# Altium project IDC_Tester_v1.PrjPcb (part 2 of 3)

## Sheet IDC_Tester_v1_LED_3.SchDoc
size 420 x 297 mm; SheetNumber: 5; SheetTotal: 9
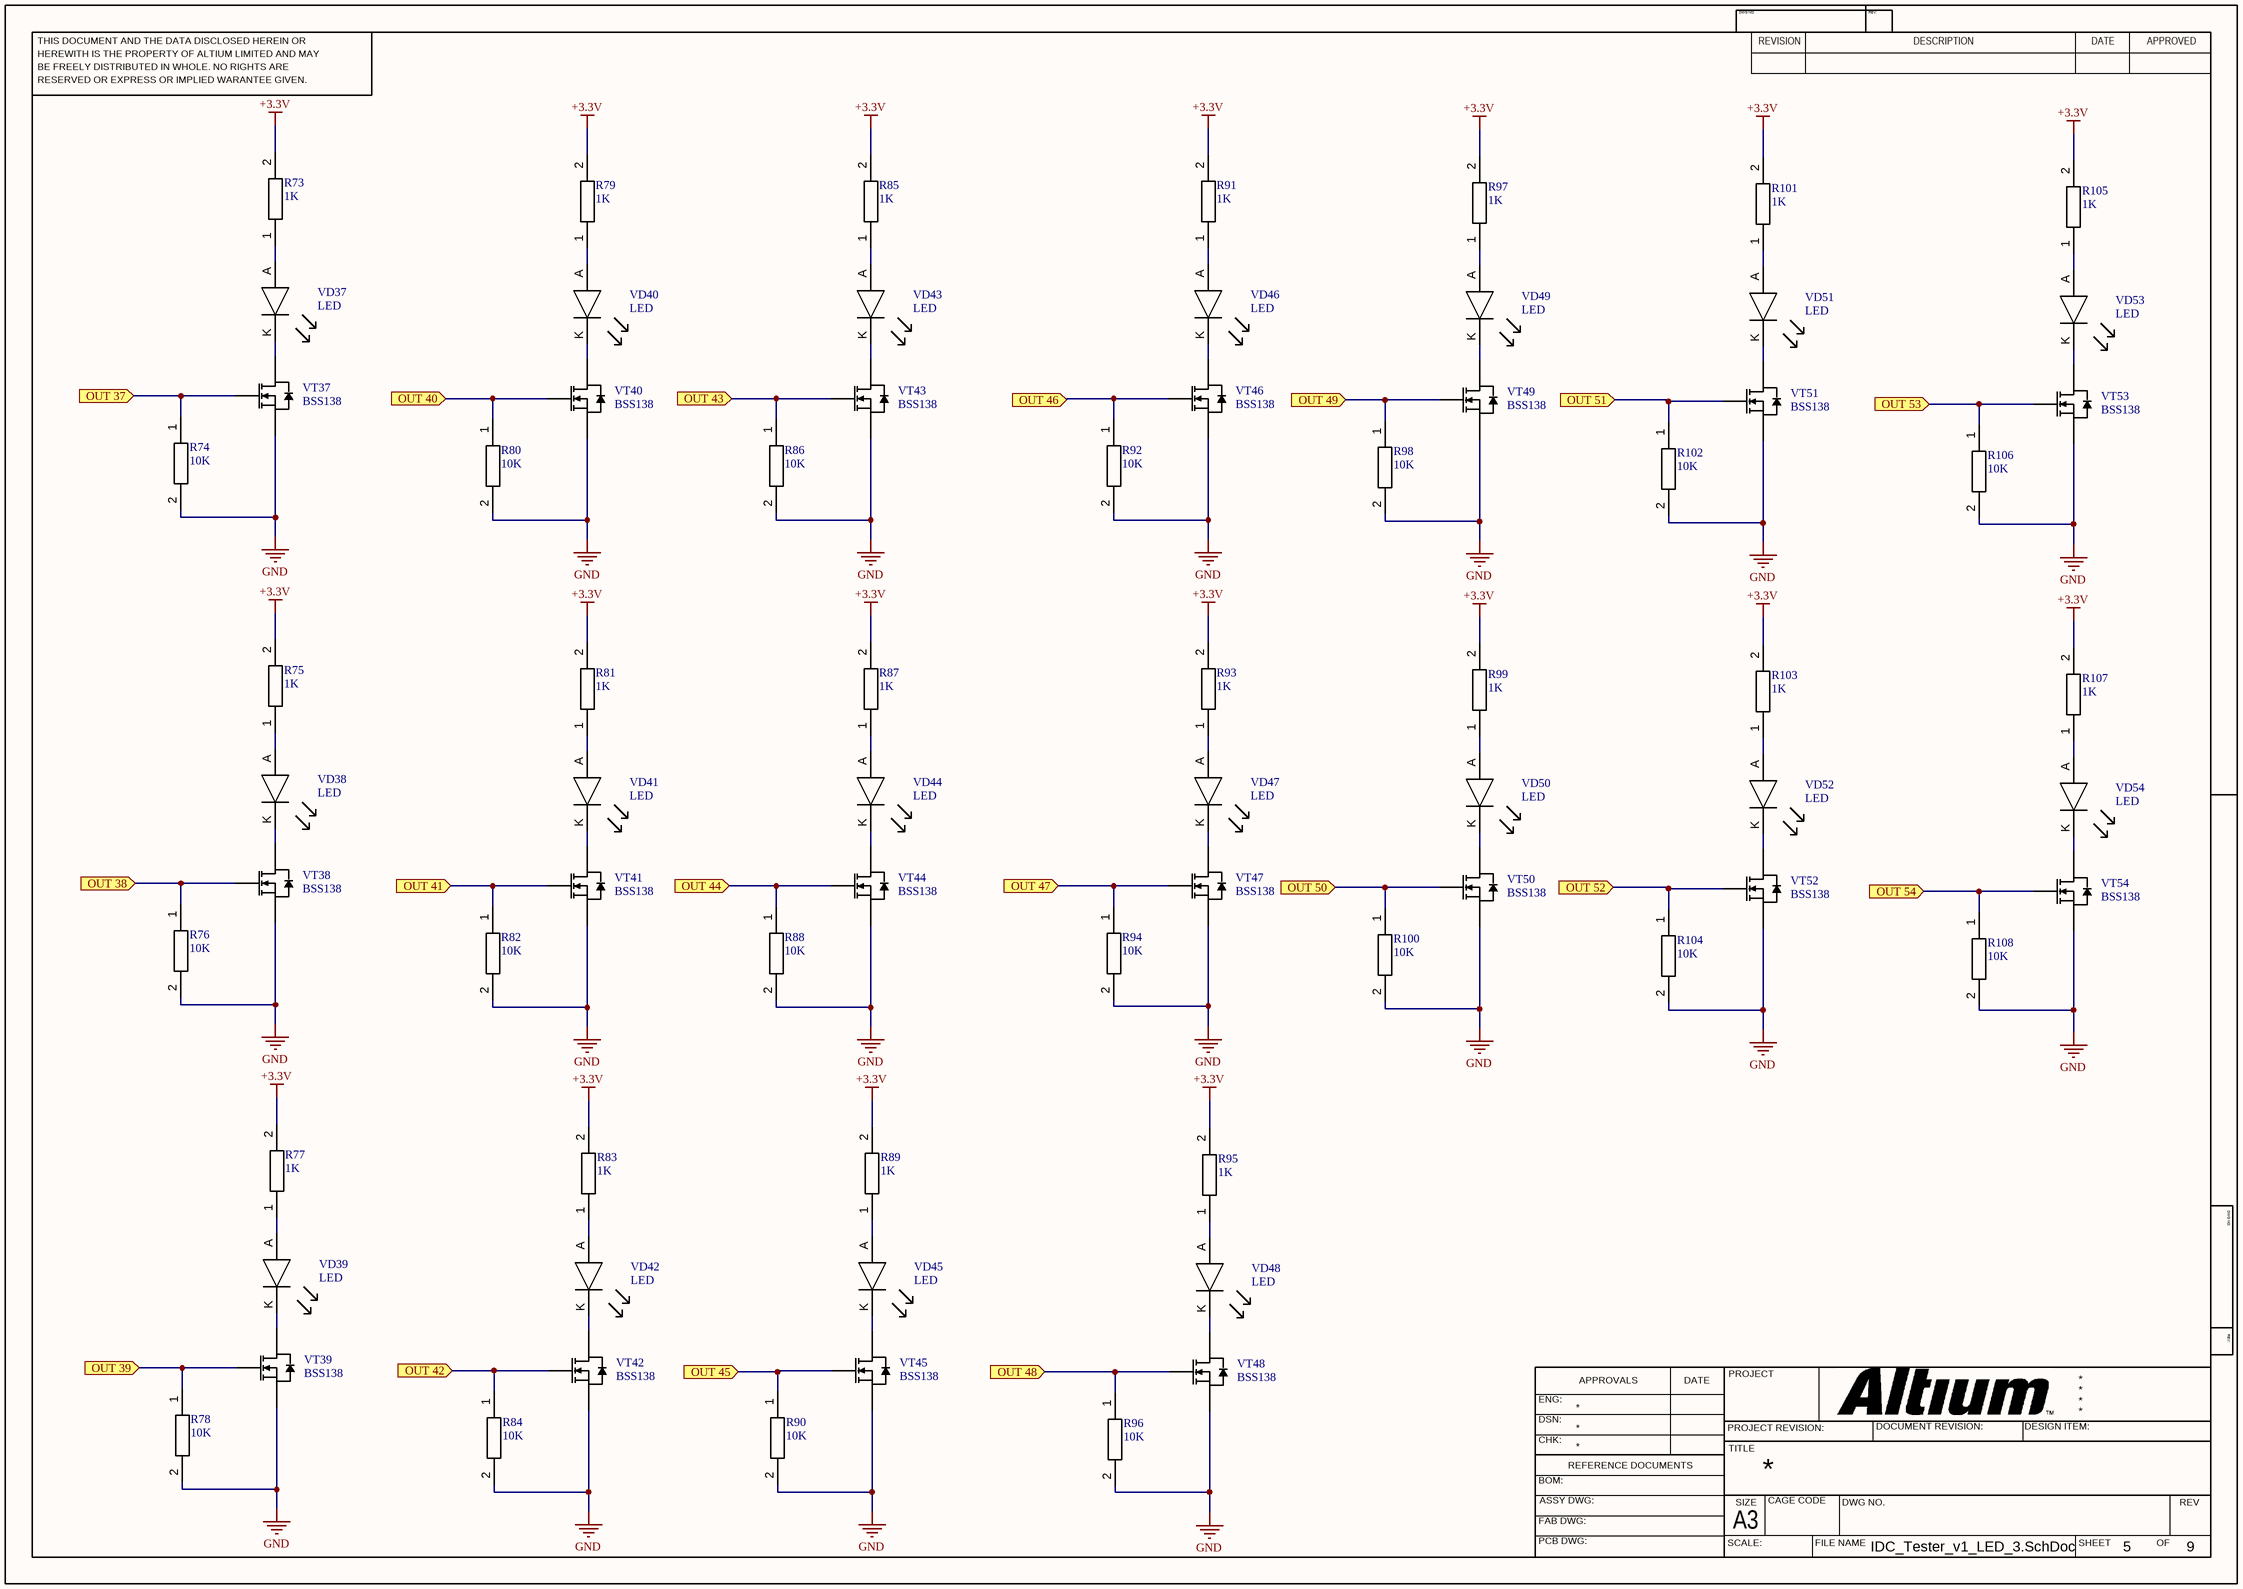
[diagram p5: IDC_Tester_v1_LED_3.SchDoc]

### Parts
R73  1K  [Resistor 0603]
R74  10K  [Resistor 0603]
R75  1K  [Resistor 0603]
R76  10K  [Resistor 0603]
R77  1K  [Resistor 0603]
R78  10K  [Resistor 0603]
R79  1K  [Resistor 0603]
R80  10K  [Resistor 0603]
R81  1K  [Resistor 0603]
R82  10K  [Resistor 0603]
R83  1K  [Resistor 0603]
R84  10K  [Resistor 0603]
R85  1K  [Resistor 0603]
R86  10K  [Resistor 0603]
R87  1K  [Resistor 0603]
R88  10K  [Resistor 0603]
R89  1K  [Resistor 0603]
R90  10K  [Resistor 0603]
R91  1K  [Resistor 0603]
R92  10K  [Resistor 0603]
R93  1K  [Resistor 0603]
R94  10K  [Resistor 0603]
R95  1K  [Resistor 0603]
R96  10K  [Resistor 0603]
R97  1K  [Resistor 0603]
R98  10K  [Resistor 0603]
R99  1K  [Resistor 0603]
R100  10K  [Resistor 0603]
R101  1K  [Resistor 0603]
R102  10K  [Resistor 0603]
R103  1K  [Resistor 0603]
R104  10K  [Resistor 0603]
R105  1K  [Resistor 0603]
R106  10K  [Resistor 0603]
R107  1K  [Resistor 0603]
R108  10K  [Resistor 0603]
VD37  LED  [Led 0603 - duplicate]
VD38  LED  [Led 0603 - duplicate]
VD39  LED  [Led 0603 - duplicate]
VD40  LED  [Led 0603 - duplicate]
VD41  LED  [Led 0603 - duplicate]
VD42  LED  [Led 0603 - duplicate]
VD43  LED  [Led 0603 - duplicate]
VD44  LED  [Led 0603 - duplicate]
VD45  LED  [Led 0603 - duplicate]
VD46  LED  [Led 0603 - duplicate]
VD47  LED  [Led 0603 - duplicate]
VD48  LED  [Led 0603 - duplicate]
VD49  LED  [Led 0603 - duplicate]
VD50  LED  [Led 0603 - duplicate]
VD51  LED  [Led 0603 - duplicate]
VD52  LED  [Led 0603 - duplicate]
VD53  LED  [Led 0603 - duplicate]
VD54  LED  [Led 0603 - duplicate]
VT37  BSS138  [SOT-23-3]
VT38  BSS138  [SOT-23-3]
VT39  BSS138  [SOT-23-3]
VT40  BSS138  [SOT-23-3]
VT41  BSS138  [SOT-23-3]
VT42  BSS138  [SOT-23-3]
VT43  BSS138  [SOT-23-3]
VT44  BSS138  [SOT-23-3]
VT45  BSS138  [SOT-23-3]
VT46  BSS138  [SOT-23-3]
VT47  BSS138  [SOT-23-3]
VT48  BSS138  [SOT-23-3]
VT49  BSS138  [SOT-23-3]
VT50  BSS138  [SOT-23-3]
VT51  BSS138  [SOT-23-3]
VT52  BSS138  [SOT-23-3]
VT53  BSS138  [SOT-23-3]
VT54  BSS138  [SOT-23-3]

### Ports
OUT 37 (in), OUT 38 (in), OUT 39 (in), OUT 40 (in), OUT 41 (in), OUT 42 (in), OUT 43 (in), OUT 44 (in), OUT 45 (in), OUT 46 (in), OUT 47 (in), OUT 48 (in), OUT 49 (in), OUT 50 (in), OUT 51 (in), OUT 52 (in), OUT 53 (in), OUT 54 (in)

### Nets
+3.3V: R73.2 R75.2 R77.2 R79.2 R81.2 R83.2 R85.2 R87.2 R89.2 R91.2 R93.2 R95.2 R97.2 R99.2 R101.2 R103.2 R105.2 R107.2
GND: R74.2 R76.2 R78.2 R80.2 R82.2 R84.2 R86.2 R88.2 R90.2 R92.2 R94.2 R96.2 R98.2 R100.2 R102.2 R104.2 R106.2 R108.2 VT37.2(S) VT38.2(S) VT39.2(S) VT40.2(S) VT41.2(S) VT42.2(S) VT43.2(S) VT44.2(S) VT45.2(S) VT46.2(S) VT47.2(S) VT48.2(S) VT49.2(S) VT50.2(S) VT51.2(S) VT52.2(S) VT53.2(S) VT54.2(S)
NetDD18_3: R74.1 VT37.1(G) ; port OUT 37
NetDD18_4: R76.1 VT38.1(G) ; port OUT 38
NetDD18_5: R78.1 VT39.1(G) ; port OUT 39
NetDD18_6: R80.1 VT40.1(G) ; port OUT 40
NetDD19_3: R90.1 VT45.1(G) ; port OUT 45
NetDD19_4: R92.1 VT46.1(G) ; port OUT 46
NetDD19_5: R94.1 VT47.1(G) ; port OUT 47
NetDD19_6: R96.1 VT48.1(G) ; port OUT 48
NetDD19_11: R82.1 VT41.1(G) ; port OUT 41
NetDD19_12: R84.1 VT42.1(G) ; port OUT 42
NetDD19_13: R86.1 VT43.1(G) ; port OUT 43
NetDD19_14: R88.1 VT44.1(G) ; port OUT 44
NetDD20_3: R106.1 VT53.1(G) ; port OUT 53
NetDD20_4: R108.1 VT54.1(G) ; port OUT 54
NetDD20_11: R98.1 VT49.1(G) ; port OUT 49
NetDD20_12: R100.1 VT50.1(G) ; port OUT 50
NetDD20_13: R102.1 VT51.1(G) ; port OUT 51
NetDD20_14: R104.1 VT52.1(G) ; port OUT 52
NetR73_1: R73.1 VD37.A
NetR75_1: R75.1 VD38.A
NetR77_1: R77.1 VD39.A
NetR79_1: R79.1 VD40.A
NetR81_1: R81.1 VD41.A
NetR83_1: R83.1 VD42.A
NetR85_1: R85.1 VD43.A
NetR87_1: R87.1 VD44.A
NetR89_1: R89.1 VD45.A
NetR91_1: R91.1 VD46.A
NetR93_1: R93.1 VD47.A
NetR95_1: R95.1 VD48.A
NetR97_1: R97.1 VD49.A
NetR99_1: R99.1 VD50.A
NetR101_1: R101.1 VD51.A
NetR103_1: R103.1 VD52.A
NetR105_1: R105.1 VD53.A
NetR107_1: R107.1 VD54.A
NetVD37_K: VD37.K VT37.3(D)
NetVD38_K: VD38.K VT38.3(D)
NetVD39_K: VD39.K VT39.3(D)
NetVD40_K: VD40.K VT40.3(D)
NetVD41_K: VD41.K VT41.3(D)
NetVD42_K: VD42.K VT42.3(D)
NetVD43_K: VD43.K VT43.3(D)
NetVD44_K: VD44.K VT44.3(D)
NetVD45_K: VD45.K VT45.3(D)
NetVD46_K: VD46.K VT46.3(D)
NetVD47_K: VD47.K VT47.3(D)
NetVD48_K: VD48.K VT48.3(D)
NetVD49_K: VD49.K VT49.3(D)
NetVD50_K: VD50.K VT50.3(D)
NetVD51_K: VD51.K VT51.3(D)
NetVD52_K: VD52.K VT52.3(D)
NetVD53_K: VD53.K VT53.3(D)
NetVD54_K: VD54.K VT54.3(D)

### Notes on the sheet
- THIS DOCUMENT AND THE DATA DISCLOSED HEREIN OR
- HEREWITH IS THE PROPERTY OF ALTIUM LIMITED AND MAY
- DWG NO:
- REVISION
- REV:
- DESCRIPTION
- DATE
- APPROVED
- BE FREELY DISTRIBUTED IN WHOLE. NO RIGHTS ARE
- RESERVED OR EXPRESS OR IMPLIED WARANTEE GIVEN.
- ENG:
- APPROVALS
- PROJECT
- DSN:
- CHK:
- REFERENCE DOCUMENTS
- PROJECT REVISION:
- TITLE
- DOCUMENT REVISION:
- DESIGN ITEM:
- BOM:
- FAB DWG:
- PCB DWG:
- ASSY DWG:
- SCALE:
- A3
- SIZE
- CAGE CODE
- FILE NAME
- DWG NO.
- SHEET
- OF
- REV

### Library data of the parts
R73 R75 R77 R79 R81 R83 R85 R87 R89 R91 R93 R95 R97 R99 R101 R103 R105 R107 = Resistor 1K: as R313 on sheet IDC_Tester_v1_mcu; Created at: 13/02/2024; Mount: MOUNT
R74 R76 R78 R80 R82 R84 R86 R88 R90 R92 R94 R96 R98 R100 R102 R104 R106 R108 = Resistor 10K: as R318 on sheet IDC_Tester_v1_mcu; Created at: 15/02/2024; Mount: MOUNT
VD37-VD54 = LED: as VD97 on sheet IDC_Tester_v1_mcu; RoHS: Yes; Category: LEDs; Stock 1: 44996; Pricing 1: 1=0,6, 10=0,368, 100=0,2114, 1000=0,16544, 2000=0,15165 (USD); MountType: SMD; Case/Package: 0603; Color: Green; Case Code (Imperial): 0603; Case Code (Metric): 1608; Packaging: Tape and Reel; Length: 1.6mm; Width: 0.8mm; Height: 0.28mm; RoHS Compliant: Yes; ComponentLink1URL: https://datasheet.octopart.com/APG1608ZGCK-Kingbright-datasheet-153682089.pdf?src-supplier=Future+Electronics; ComponentLink1Description: https://datasheet.octopart.com/APG1608ZGCK-Kingbright-datasheet-153682089.pdf?src-supplier=Future+Electronics; ComponentLink2URL: http://www.kingbrightusa.com/images/catalog/SPEC/APG1608ZGCK.pdf?src-supplier=Digikey; ComponentLink2Description: http://www.kingbrightusa.com/images/catalog/SPEC/APG1608ZGCK.pdf?src-supplier=Digikey; ComponentLink3URL: https://datasheet.octopart.com/APG1608ZGCK-Kingbright-datasheet-137408059.pdf?src-supplier=Sager+Electronics; ComponentLink3Description: https://datasheet.octopart.com/APG1608ZGCK-Kingbright-datasheet-137408059.pdf?src-supplier=Sager+Electronics; Supplier Part Number 1: 754-2113-1-ND; Created at: 13/02/2024; Mount: MOUNT; Part Number: APG1608ZGCK; Supplier 1: Digikey
VT37-VT54 = BSS138: as VT1 on sheet IDC_Tester_v1_LED; Part Number: BSS138; Mount: MOUNT; MountType: SMD; Created_at: 03/12/2019

## Sheet IDC_Tester_v1_LED_4.SchDoc
size 420 x 297 mm; SheetNumber: 6; SheetTotal: 9
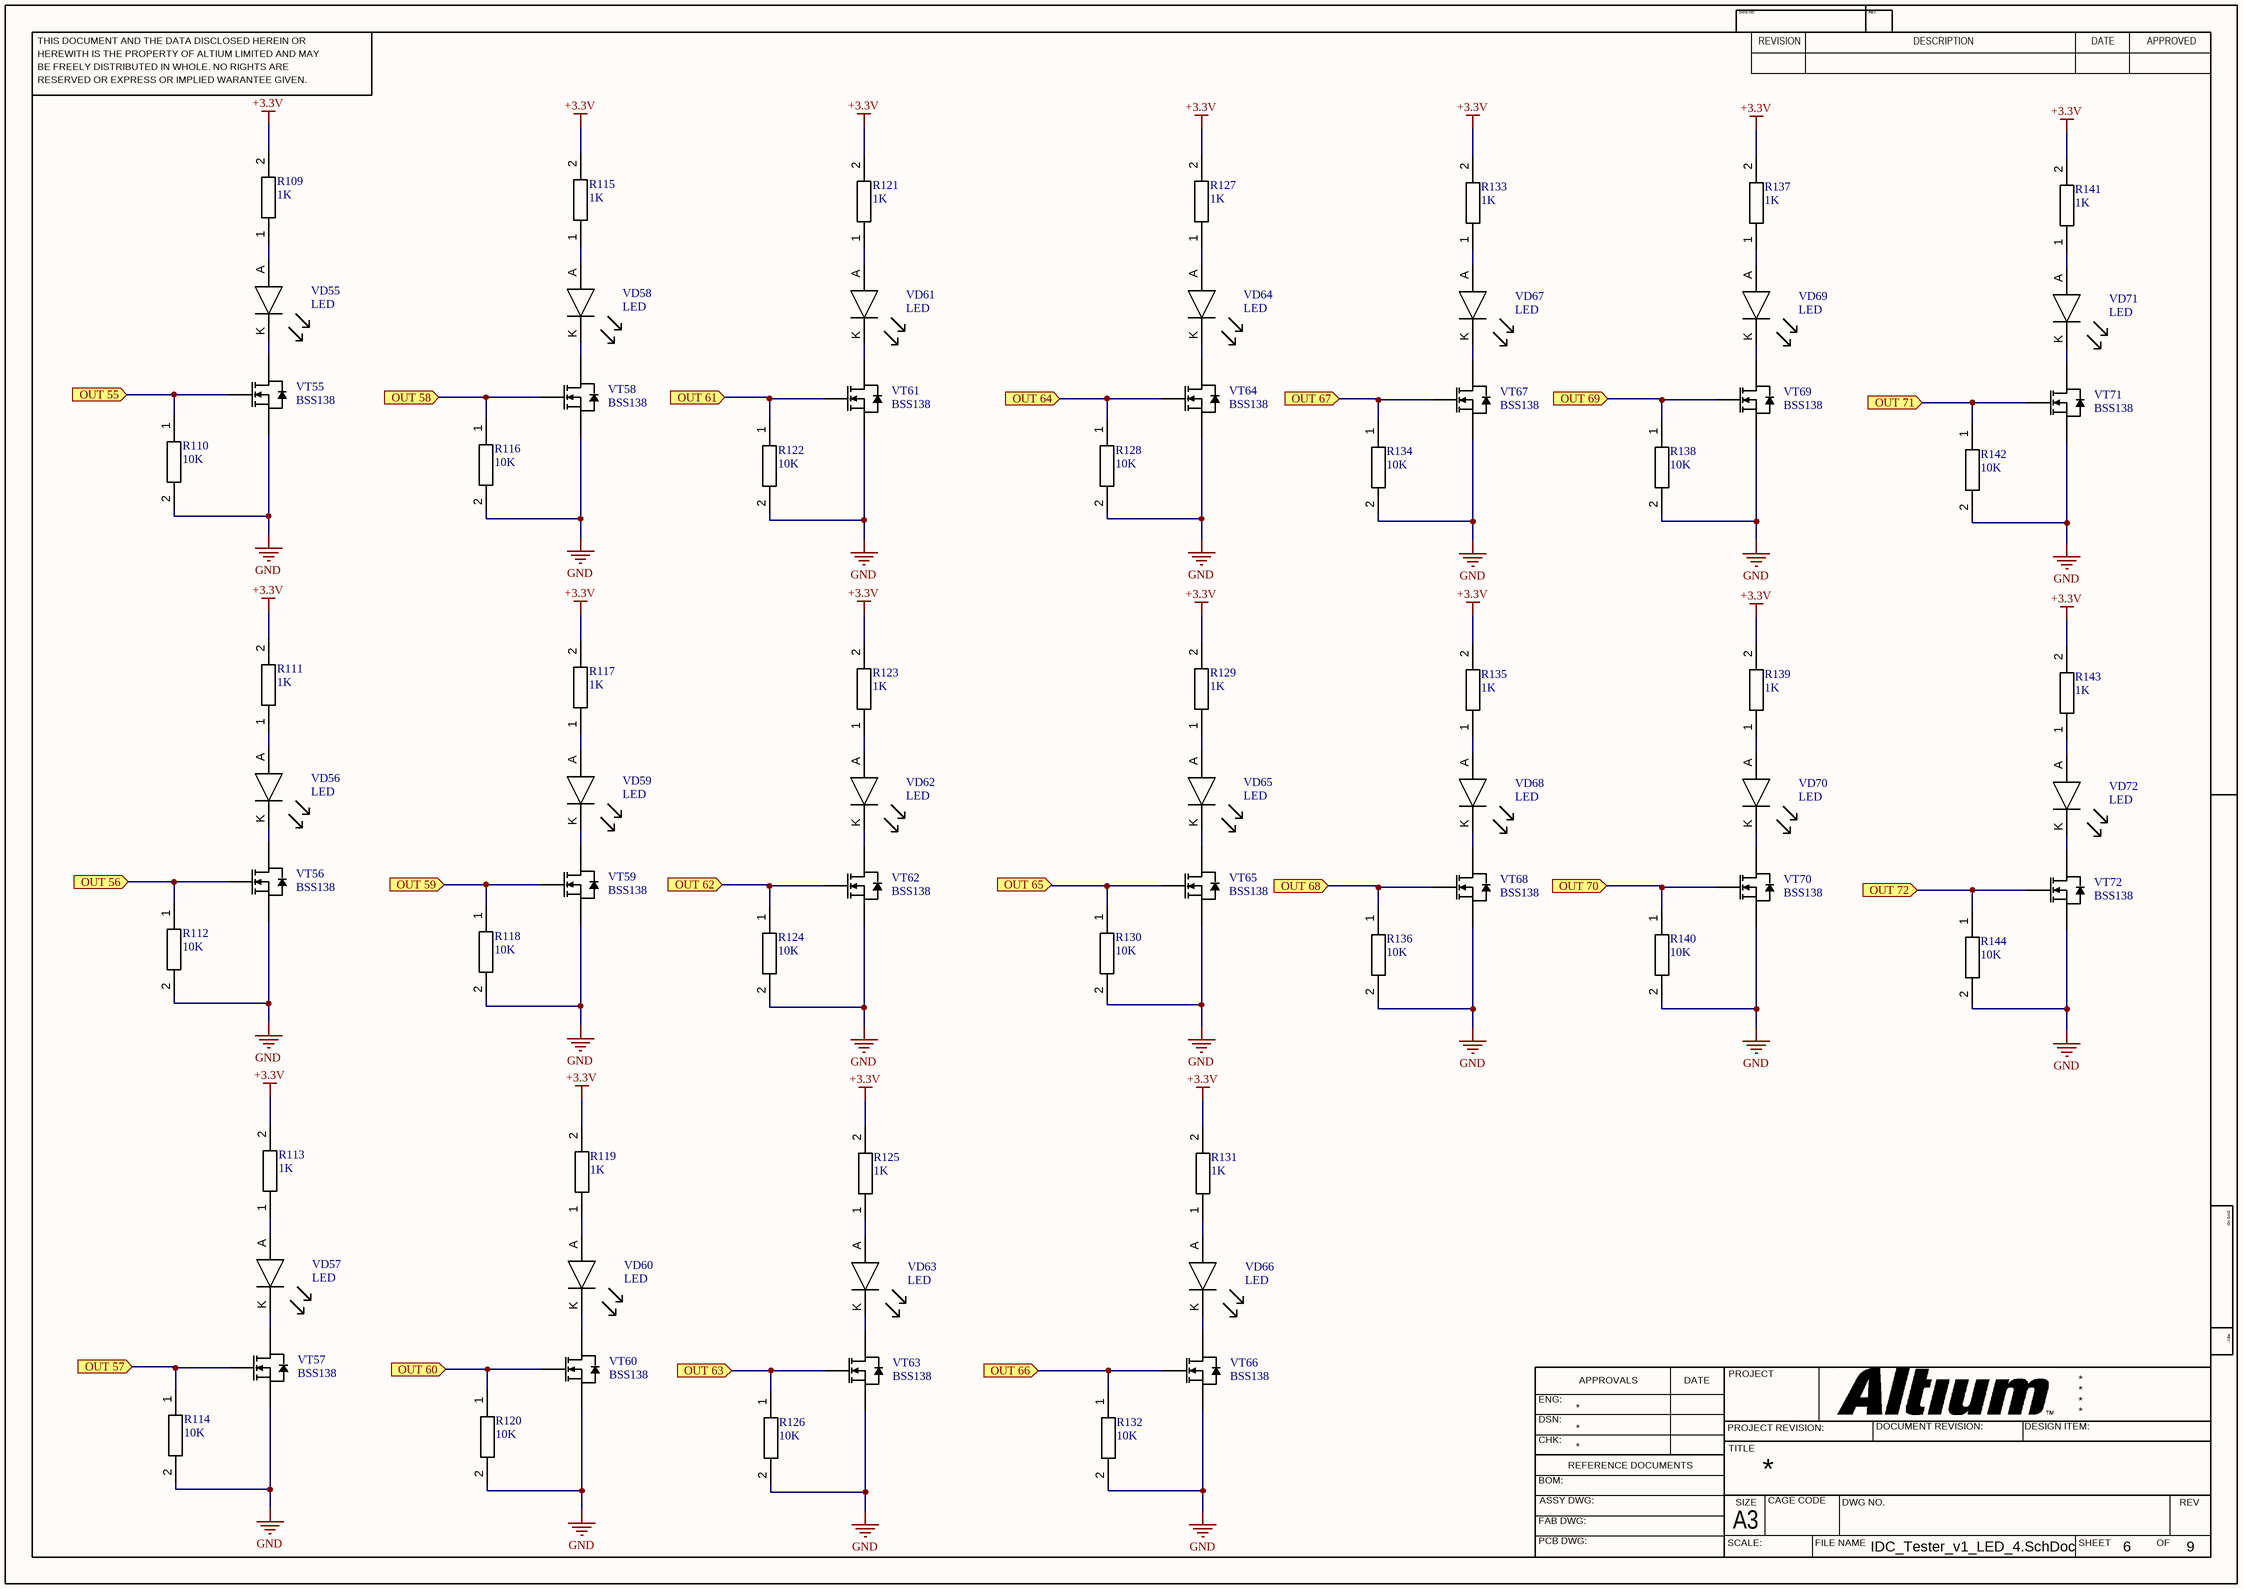
[diagram p6: IDC_Tester_v1_LED_4.SchDoc]

### Parts
R109  1K  [Resistor 0603]
R110  10K  [Resistor 0603]
R111  1K  [Resistor 0603]
R112  10K  [Resistor 0603]
R113  1K  [Resistor 0603]
R114  10K  [Resistor 0603]
R115  1K  [Resistor 0603]
R116  10K  [Resistor 0603]
R117  1K  [Resistor 0603]
R118  10K  [Resistor 0603]
R119  1K  [Resistor 0603]
R120  10K  [Resistor 0603]
R121  1K  [Resistor 0603]
R122  10K  [Resistor 0603]
R123  1K  [Resistor 0603]
R124  10K  [Resistor 0603]
R125  1K  [Resistor 0603]
R126  10K  [Resistor 0603]
R127  1K  [Resistor 0603]
R128  10K  [Resistor 0603]
R129  1K  [Resistor 0603]
R130  10K  [Resistor 0603]
R131  1K  [Resistor 0603]
R132  10K  [Resistor 0603]
R133  1K  [Resistor 0603]
R134  10K  [Resistor 0603]
R135  1K  [Resistor 0603]
R136  10K  [Resistor 0603]
R137  1K  [Resistor 0603]
R138  10K  [Resistor 0603]
R139  1K  [Resistor 0603]
R140  10K  [Resistor 0603]
R141  1K  [Resistor 0603]
R142  10K  [Resistor 0603]
R143  1K  [Resistor 0603]
R144  10K  [Resistor 0603]
VD55  LED  [Led 0603 - duplicate]
VD56  LED  [Led 0603 - duplicate]
VD57  LED  [Led 0603 - duplicate]
VD58  LED  [Led 0603 - duplicate]
VD59  LED  [Led 0603 - duplicate]
VD60  LED  [Led 0603 - duplicate]
VD61  LED  [Led 0603 - duplicate]
VD62  LED  [Led 0603 - duplicate]
VD63  LED  [Led 0603 - duplicate]
VD64  LED  [Led 0603 - duplicate]
VD65  LED  [Led 0603 - duplicate]
VD66  LED  [Led 0603 - duplicate]
VD67  LED  [Led 0603 - duplicate]
VD68  LED  [Led 0603 - duplicate]
VD69  LED  [Led 0603 - duplicate]
VD70  LED  [Led 0603 - duplicate]
VD71  LED  [Led 0603 - duplicate]
VD72  LED  [Led 0603 - duplicate]
VT55  BSS138  [SOT-23-3]
VT56  BSS138  [SOT-23-3]
VT57  BSS138  [SOT-23-3]
VT58  BSS138  [SOT-23-3]
VT59  BSS138  [SOT-23-3]
VT60  BSS138  [SOT-23-3]
VT61  BSS138  [SOT-23-3]
VT62  BSS138  [SOT-23-3]
VT63  BSS138  [SOT-23-3]
VT64  BSS138  [SOT-23-3]
VT65  BSS138  [SOT-23-3]
VT66  BSS138  [SOT-23-3]
VT67  BSS138  [SOT-23-3]
VT68  BSS138  [SOT-23-3]
VT69  BSS138  [SOT-23-3]
VT70  BSS138  [SOT-23-3]
VT71  BSS138  [SOT-23-3]
VT72  BSS138  [SOT-23-3]

### Ports
OUT 55 (in), OUT 56 (in), OUT 57 (in), OUT 58 (in), OUT 59 (in), OUT 60 (in), OUT 61 (in), OUT 62 (in), OUT 63 (in), OUT 64 (in), OUT 65 (in), OUT 66 (in), OUT 67 (in), OUT 68 (in), OUT 69 (in), OUT 70 (in), OUT 71 (in), OUT 72 (in)

### Nets
+3.3V: R109.2 R111.2 R113.2 R115.2 R117.2 R119.2 R121.2 R123.2 R125.2 R127.2 R129.2 R131.2 R133.2 R135.2 R137.2 R139.2 R141.2 R143.2
GND: R110.2 R112.2 R114.2 R116.2 R118.2 R120.2 R122.2 R124.2 R126.2 R128.2 R130.2 R132.2 R134.2 R136.2 R138.2 R140.2 R142.2 R144.2 VT55.2(S) VT56.2(S) VT57.2(S) VT58.2(S) VT59.2(S) VT60.2(S) VT61.2(S) VT62.2(S) VT63.2(S) VT64.2(S) VT65.2(S) VT66.2(S) VT67.2(S) VT68.2(S) VT69.2(S) VT70.2(S) VT71.2(S) VT72.2(S)
NetDD20_5: R110.1 VT55.1(G) ; port OUT 55
NetDD20_6: R112.1 VT56.1(G) ; port OUT 56
NetDD21_3: R122.1 VT61.1(G) ; port OUT 61
NetDD21_4: R124.1 VT62.1(G) ; port OUT 62
NetDD21_5: R126.1 VT63.1(G) ; port OUT 63
NetDD21_6: R128.1 VT64.1(G) ; port OUT 64
NetDD21_11: R114.1 VT57.1(G) ; port OUT 57
NetDD21_12: R116.1 VT58.1(G) ; port OUT 58
NetDD21_13: R118.1 VT59.1(G) ; port OUT 59
NetDD21_14: R120.1 VT60.1(G) ; port OUT 60
NetDD22_3: R138.1 VT69.1(G) ; port OUT 69
NetDD22_4: R140.1 VT70.1(G) ; port OUT 70
NetDD22_5: R142.1 VT71.1(G) ; port OUT 71
NetDD22_6: R144.1 VT72.1(G) ; port OUT 72
NetDD22_11: R130.1 VT65.1(G) ; port OUT 65
NetDD22_12: R132.1 VT66.1(G) ; port OUT 66
NetDD22_13: R134.1 VT67.1(G) ; port OUT 67
NetDD22_14: R136.1 VT68.1(G) ; port OUT 68
NetR109_1: R109.1 VD55.A
NetR111_1: R111.1 VD56.A
NetR113_1: R113.1 VD57.A
NetR115_1: R115.1 VD58.A
NetR117_1: R117.1 VD59.A
NetR119_1: R119.1 VD60.A
NetR121_1: R121.1 VD61.A
NetR123_1: R123.1 VD62.A
NetR125_1: R125.1 VD63.A
NetR127_1: R127.1 VD64.A
NetR129_1: R129.1 VD65.A
NetR131_1: R131.1 VD66.A
NetR133_1: R133.1 VD67.A
NetR135_1: R135.1 VD68.A
NetR137_1: R137.1 VD69.A
NetR139_1: R139.1 VD70.A
NetR141_1: R141.1 VD71.A
NetR143_1: R143.1 VD72.A
NetVD55_K: VD55.K VT55.3(D)
NetVD56_K: VD56.K VT56.3(D)
NetVD57_K: VD57.K VT57.3(D)
NetVD58_K: VD58.K VT58.3(D)
NetVD59_K: VD59.K VT59.3(D)
NetVD60_K: VD60.K VT60.3(D)
NetVD61_K: VD61.K VT61.3(D)
NetVD62_K: VD62.K VT62.3(D)
NetVD63_K: VD63.K VT63.3(D)
NetVD64_K: VD64.K VT64.3(D)
NetVD65_K: VD65.K VT65.3(D)
NetVD66_K: VD66.K VT66.3(D)
NetVD67_K: VD67.K VT67.3(D)
NetVD68_K: VD68.K VT68.3(D)
NetVD69_K: VD69.K VT69.3(D)
NetVD70_K: VD70.K VT70.3(D)
NetVD71_K: VD71.K VT71.3(D)
NetVD72_K: VD72.K VT72.3(D)

### Notes on the sheet
- THIS DOCUMENT AND THE DATA DISCLOSED HEREIN OR
- HEREWITH IS THE PROPERTY OF ALTIUM LIMITED AND MAY
- DWG NO:
- REVISION
- REV:
- DESCRIPTION
- DATE
- APPROVED
- BE FREELY DISTRIBUTED IN WHOLE. NO RIGHTS ARE
- RESERVED OR EXPRESS OR IMPLIED WARANTEE GIVEN.
- ENG:
- APPROVALS
- PROJECT
- DSN:
- CHK:
- REFERENCE DOCUMENTS
- PROJECT REVISION:
- TITLE
- DOCUMENT REVISION:
- DESIGN ITEM:
- BOM:
- FAB DWG:
- PCB DWG:
- ASSY DWG:
- SCALE:
- A3
- SIZE
- CAGE CODE
- FILE NAME
- DWG NO.
- SHEET
- OF
- REV

### Library data of the parts
R109 R111 R113 R115 R117 R119 R121 R123 R125 R127 R129 R131 R133 R135 R137 R139 R141 R143 = Resistor 1K: as R313 on sheet IDC_Tester_v1_mcu; Created at: 13/02/2024; Mount: MOUNT
R110 R112 R114 R116 R118 R120 R122 R124 R126 R128 R130 R132 R134 R136 R138 R140 R142 R144 = Resistor 10K: as R318 on sheet IDC_Tester_v1_mcu; Created at: 15/02/2024; Mount: MOUNT
VD55-VD72 = LED: as VD97 on sheet IDC_Tester_v1_mcu; RoHS: Yes; Category: LEDs; Stock 1: 44996; Pricing 1: 1=0,6, 10=0,368, 100=0,2114, 1000=0,16544, 2000=0,15165 (USD); MountType: SMD; Case/Package: 0603; Color: Green; Case Code (Imperial): 0603; Case Code (Metric): 1608; Packaging: Tape and Reel; Length: 1.6mm; Width: 0.8mm; Height: 0.28mm; RoHS Compliant: Yes; ComponentLink1URL: https://datasheet.octopart.com/APG1608ZGCK-Kingbright-datasheet-153682089.pdf?src-supplier=Future+Electronics; ComponentLink1Description: https://datasheet.octopart.com/APG1608ZGCK-Kingbright-datasheet-153682089.pdf?src-supplier=Future+Electronics; ComponentLink2URL: http://www.kingbrightusa.com/images/catalog/SPEC/APG1608ZGCK.pdf?src-supplier=Digikey; ComponentLink2Description: http://www.kingbrightusa.com/images/catalog/SPEC/APG1608ZGCK.pdf?src-supplier=Digikey; ComponentLink3URL: https://datasheet.octopart.com/APG1608ZGCK-Kingbright-datasheet-137408059.pdf?src-supplier=Sager+Electronics; ComponentLink3Description: https://datasheet.octopart.com/APG1608ZGCK-Kingbright-datasheet-137408059.pdf?src-supplier=Sager+Electronics; Supplier Part Number 1: 754-2113-1-ND; Created at: 13/02/2024; Mount: MOUNT; Part Number: APG1608ZGCK; Supplier 1: Digikey
VT55-VT72 = BSS138: as VT1 on sheet IDC_Tester_v1_LED; Part Number: BSS138; Mount: MOUNT; MountType: SMD; Created_at: 03/12/2019

## Sheet IDC_Tester_v1_LED_5.SchDoc
size 420 x 297 mm; SheetNumber: 8; SheetTotal: 10
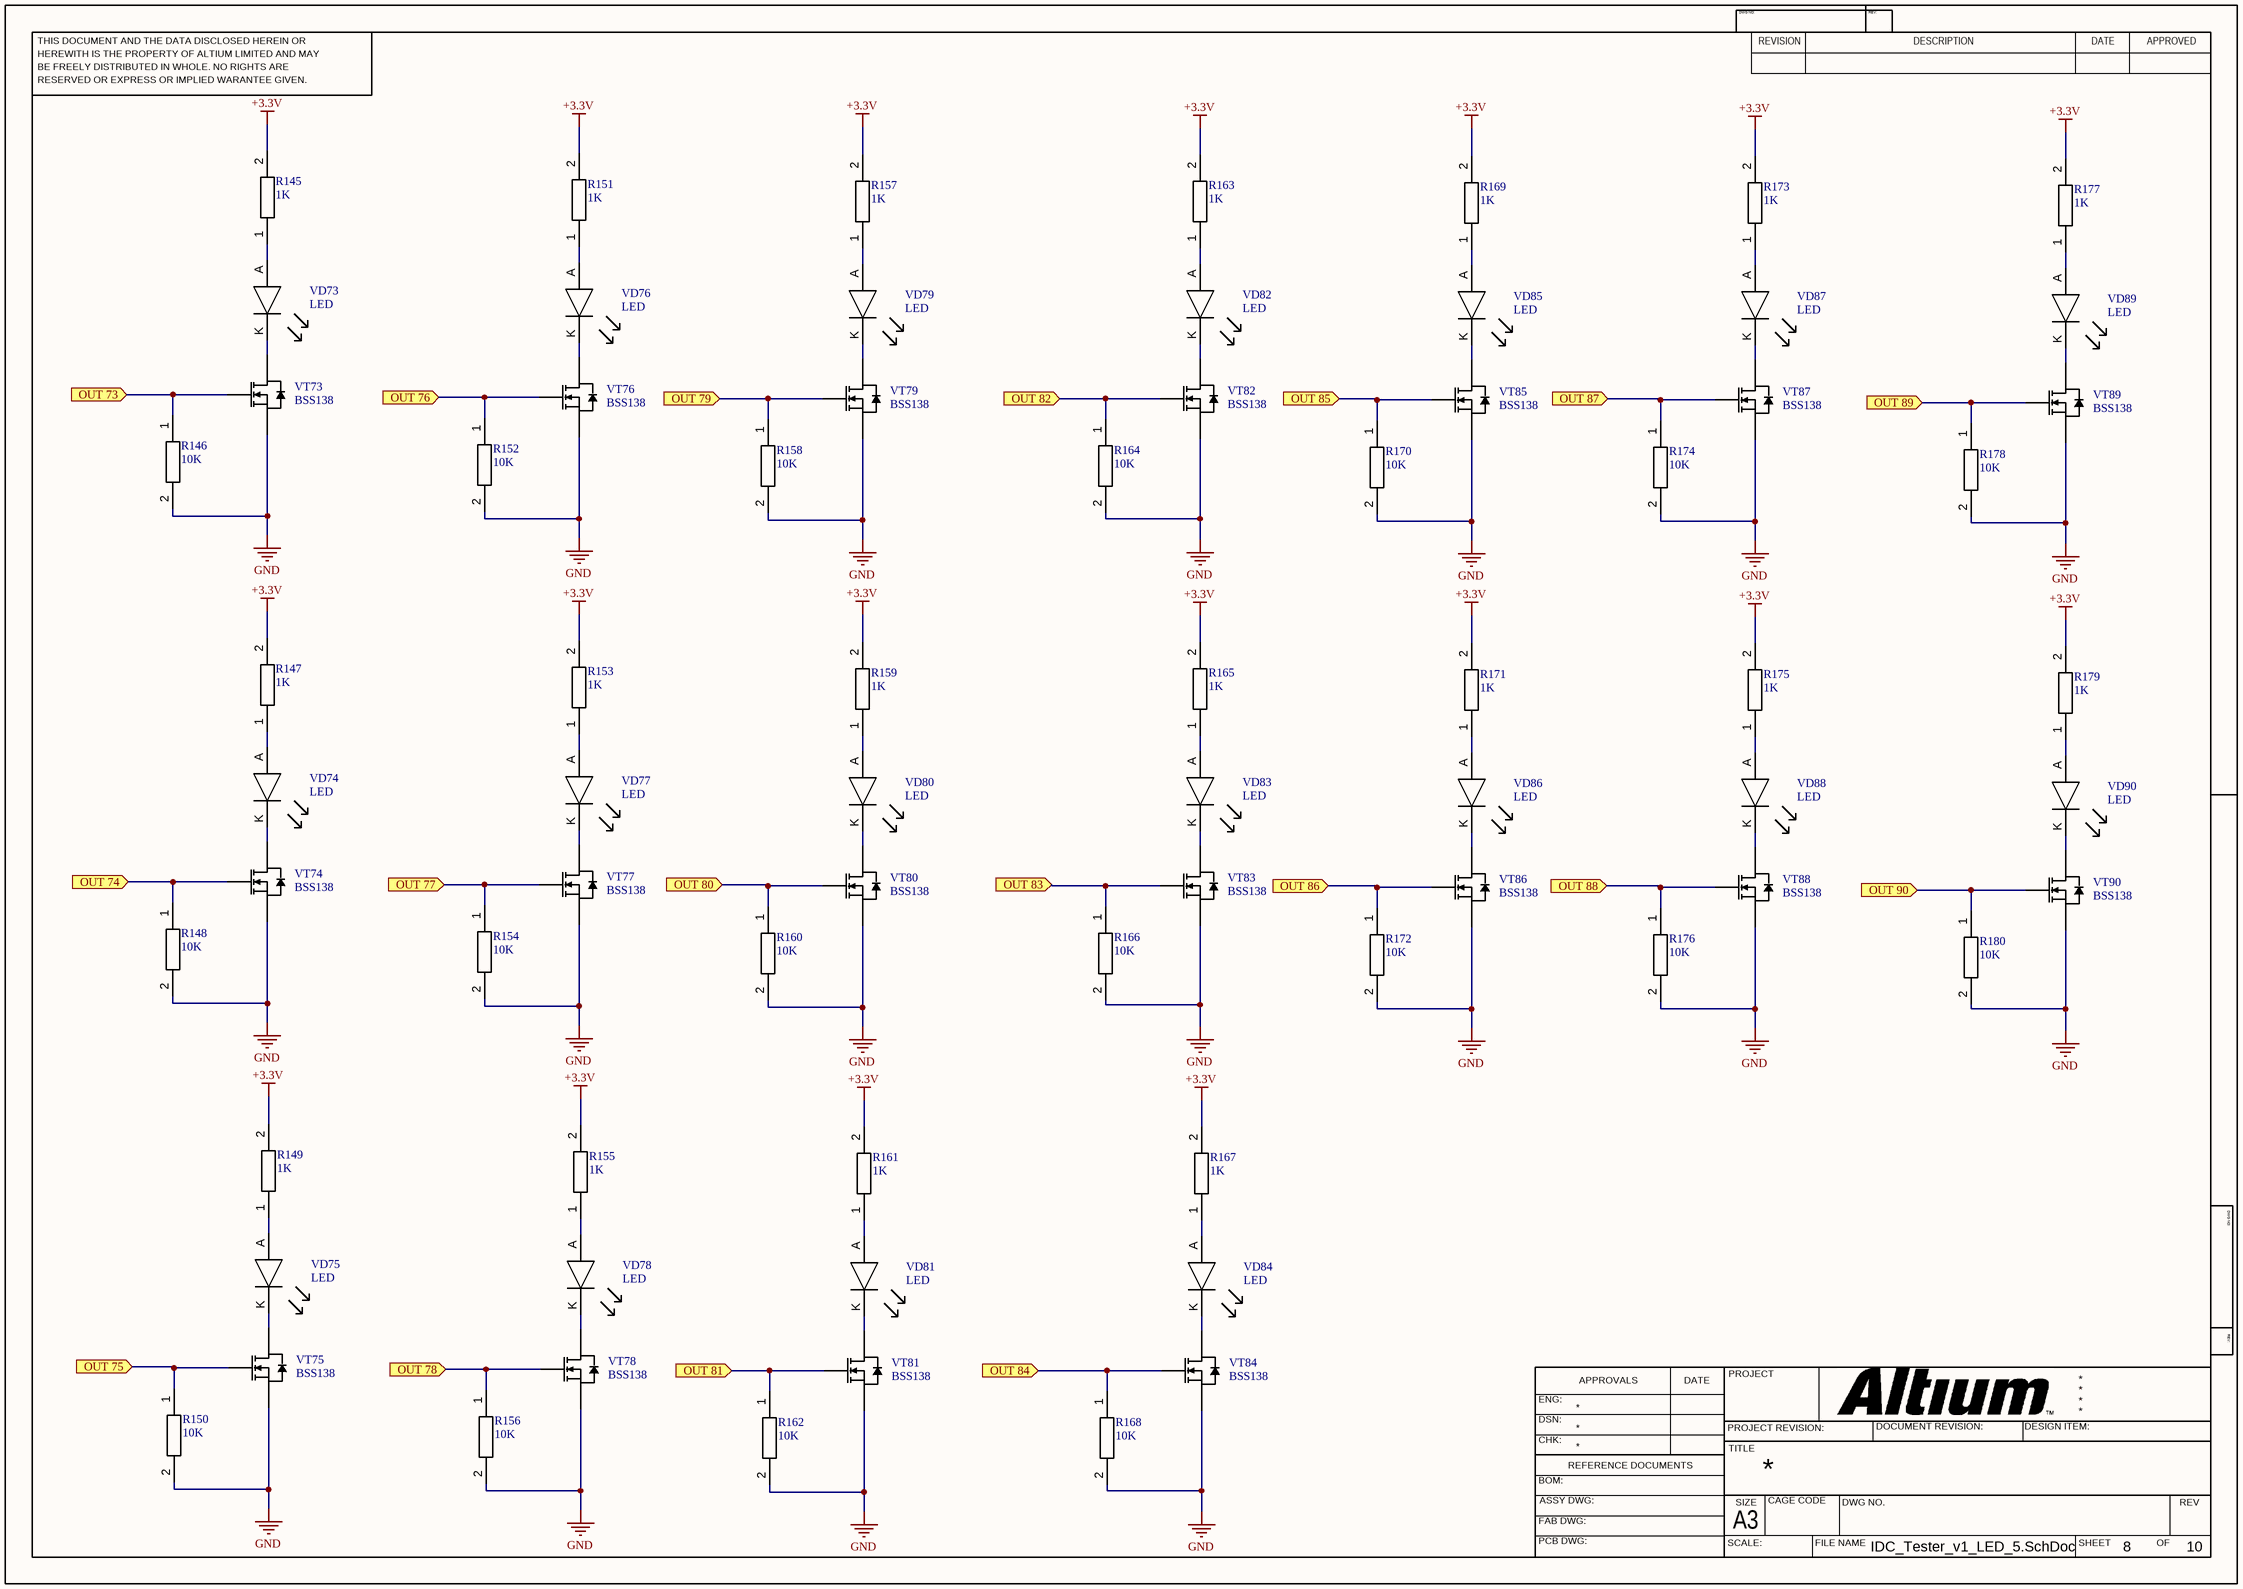
[diagram p7: IDC_Tester_v1_LED_5.SchDoc]

### Parts
R145  1K  [Resistor 0603]
R146  10K  [Resistor 0603]
R147  1K  [Resistor 0603]
R148  10K  [Resistor 0603]
R149  1K  [Resistor 0603]
R150  10K  [Resistor 0603]
R151  1K  [Resistor 0603]
R152  10K  [Resistor 0603]
R153  1K  [Resistor 0603]
R154  10K  [Resistor 0603]
R155  1K  [Resistor 0603]
R156  10K  [Resistor 0603]
R157  1K  [Resistor 0603]
R158  10K  [Resistor 0603]
R159  1K  [Resistor 0603]
R160  10K  [Resistor 0603]
R161  1K  [Resistor 0603]
R162  10K  [Resistor 0603]
R163  1K  [Resistor 0603]
R164  10K  [Resistor 0603]
R165  1K  [Resistor 0603]
R166  10K  [Resistor 0603]
R167  1K  [Resistor 0603]
R168  10K  [Resistor 0603]
R169  1K  [Resistor 0603]
R170  10K  [Resistor 0603]
R171  1K  [Resistor 0603]
R172  10K  [Resistor 0603]
R173  1K  [Resistor 0603]
R174  10K  [Resistor 0603]
R175  1K  [Resistor 0603]
R176  10K  [Resistor 0603]
R177  1K  [Resistor 0603]
R178  10K  [Resistor 0603]
R179  1K  [Resistor 0603]
R180  10K  [Resistor 0603]
VD73  LED  [Led 0603 - duplicate]
VD74  LED  [Led 0603 - duplicate]
VD75  LED  [Led 0603 - duplicate]
VD76  LED  [Led 0603 - duplicate]
VD77  LED  [Led 0603 - duplicate]
VD78  LED  [Led 0603 - duplicate]
VD79  LED  [Led 0603 - duplicate]
VD80  LED  [Led 0603 - duplicate]
VD81  LED  [Led 0603 - duplicate]
VD82  LED  [Led 0603 - duplicate]
VD83  LED  [Led 0603 - duplicate]
VD84  LED  [Led 0603 - duplicate]
VD85  LED  [Led 0603 - duplicate]
VD86  LED  [Led 0603 - duplicate]
VD87  LED  [Led 0603 - duplicate]
VD88  LED  [Led 0603 - duplicate]
VD89  LED  [Led 0603 - duplicate]
VD90  LED  [Led 0603 - duplicate]
VT73  BSS138  [SOT-23-3]
VT74  BSS138  [SOT-23-3]
VT75  BSS138  [SOT-23-3]
VT76  BSS138  [SOT-23-3]
VT77  BSS138  [SOT-23-3]
VT78  BSS138  [SOT-23-3]
VT79  BSS138  [SOT-23-3]
VT80  BSS138  [SOT-23-3]
VT81  BSS138  [SOT-23-3]
VT82  BSS138  [SOT-23-3]
VT83  BSS138  [SOT-23-3]
VT84  BSS138  [SOT-23-3]
VT85  BSS138  [SOT-23-3]
VT86  BSS138  [SOT-23-3]
VT87  BSS138  [SOT-23-3]
VT88  BSS138  [SOT-23-3]
VT89  BSS138  [SOT-23-3]
VT90  BSS138  [SOT-23-3]

### Ports
OUT 73 (in), OUT 74 (in), OUT 75 (in), OUT 76 (in), OUT 77 (in), OUT 78 (in), OUT 79 (in), OUT 80 (in), OUT 81 (in), OUT 82 (in), OUT 83 (in), OUT 84 (in), OUT 85 (in), OUT 86 (in), OUT 87 (in), OUT 88 (in), OUT 89 (in), OUT 90 (in)

### Nets
+3.3V: R145.2 R147.2 R149.2 R151.2 R153.2 R155.2 R157.2 R159.2 R161.2 R163.2 R165.2 R167.2 R169.2 R171.2 R173.2 R175.2 R177.2 R179.2
GND: R146.2 R148.2 R150.2 R152.2 R154.2 R156.2 R158.2 R160.2 R162.2 R164.2 R166.2 R168.2 R170.2 R172.2 R174.2 R176.2 R178.2 R180.2 VT73.2(S) VT74.2(S) VT75.2(S) VT76.2(S) VT77.2(S) VT78.2(S) VT79.2(S) VT80.2(S) VT81.2(S) VT82.2(S) VT83.2(S) VT84.2(S) VT85.2(S) VT86.2(S) VT87.2(S) VT88.2(S) VT89.2(S) VT90.2(S)
NetDD23_3: R154.1 VT77.1(G) ; port OUT 77
NetDD23_4: R156.1 VT78.1(G) ; port OUT 78
NetDD23_5: R158.1 VT79.1(G) ; port OUT 79
NetDD23_6: R160.1 VT80.1(G) ; port OUT 80
NetDD23_11: R146.1 VT73.1(G) ; port OUT 73
NetDD23_12: R148.1 VT74.1(G) ; port OUT 74
NetDD23_13: R150.1 VT75.1(G) ; port OUT 75
NetDD23_14: R152.1 VT76.1(G) ; port OUT 76
NetDD24_3: R170.1 VT85.1(G) ; port OUT 85
NetDD24_4: R172.1 VT86.1(G) ; port OUT 86
NetDD24_5: R174.1 VT87.1(G) ; port OUT 87
NetDD24_6: R176.1 VT88.1(G) ; port OUT 88
NetDD24_11: R162.1 VT81.1(G) ; port OUT 81
NetDD24_12: R164.1 VT82.1(G) ; port OUT 82
NetDD24_13: R166.1 VT83.1(G) ; port OUT 83
NetDD24_14: R168.1 VT84.1(G) ; port OUT 84
NetDD25_11: R178.1 VT89.1(G) ; port OUT 89
NetDD25_12: R180.1 VT90.1(G) ; port OUT 90
NetR145_1: R145.1 VD73.A
NetR147_1: R147.1 VD74.A
NetR149_1: R149.1 VD75.A
NetR151_1: R151.1 VD76.A
NetR153_1: R153.1 VD77.A
NetR155_1: R155.1 VD78.A
NetR157_1: R157.1 VD79.A
NetR159_1: R159.1 VD80.A
NetR161_1: R161.1 VD81.A
NetR163_1: R163.1 VD82.A
NetR165_1: R165.1 VD83.A
NetR167_1: R167.1 VD84.A
NetR169_1: R169.1 VD85.A
NetR171_1: R171.1 VD86.A
NetR173_1: R173.1 VD87.A
NetR175_1: R175.1 VD88.A
NetR177_1: R177.1 VD89.A
NetR179_1: R179.1 VD90.A
NetVD73_K: VD73.K VT73.3(D)
NetVD74_K: VD74.K VT74.3(D)
NetVD75_K: VD75.K VT75.3(D)
NetVD76_K: VD76.K VT76.3(D)
NetVD77_K: VD77.K VT77.3(D)
NetVD78_K: VD78.K VT78.3(D)
NetVD79_K: VD79.K VT79.3(D)
NetVD80_K: VD80.K VT80.3(D)
NetVD81_K: VD81.K VT81.3(D)
NetVD82_K: VD82.K VT82.3(D)
NetVD83_K: VD83.K VT83.3(D)
NetVD84_K: VD84.K VT84.3(D)
NetVD85_K: VD85.K VT85.3(D)
NetVD86_K: VD86.K VT86.3(D)
NetVD87_K: VD87.K VT87.3(D)
NetVD88_K: VD88.K VT88.3(D)
NetVD89_K: VD89.K VT89.3(D)
NetVD90_K: VD90.K VT90.3(D)

### Notes on the sheet
- THIS DOCUMENT AND THE DATA DISCLOSED HEREIN OR
- HEREWITH IS THE PROPERTY OF ALTIUM LIMITED AND MAY
- DWG NO:
- REVISION
- REV:
- DESCRIPTION
- DATE
- APPROVED
- BE FREELY DISTRIBUTED IN WHOLE. NO RIGHTS ARE
- RESERVED OR EXPRESS OR IMPLIED WARANTEE GIVEN.
- ENG:
- APPROVALS
- PROJECT
- DSN:
- CHK:
- REFERENCE DOCUMENTS
- PROJECT REVISION:
- TITLE
- DOCUMENT REVISION:
- DESIGN ITEM:
- BOM:
- FAB DWG:
- PCB DWG:
- ASSY DWG:
- SCALE:
- A3
- SIZE
- CAGE CODE
- FILE NAME
- DWG NO.
- SHEET
- OF
- REV

### Library data of the parts
R145 R147 R149 R151 R153 R155 R157 R159 R161 R163 R165 R167 R169 R171 R173 R175 R177 R179 = Resistor 1K: Part Number: SMD RES 1K OHM 1%±100ppm/°C 0603 (RMCF0603FT1K00); Added by: viskov2055@gmail.com; Mount_Type: SMD; Solder_Amount: 2; Pkg: 0603; Created at: 13/02/2024; Mount: MOUNT
R146 R148 R150 R152 R154 R156 R158 R160 R162 R164 R166 R168 R170 R172 R174 R176 R178 R180 = Resistor 10K: Part Number: SMD RES 10K OHM 1%±100ppm/°C 0603 (RMCF0603FT10K0); Added by: viskov2055@gmail.com; Mount_Type: SMD; Solder_Amount: 2; Pkg: 0603; Created at: 15/02/2024; Mount: MOUNT
VD73-VD90 = LED: LED Uni-Color Green 515nm 2-Pin SMD T/R; Manufacturer: Kingbright; Manufacturer Part Number: APG1608ZGCK; Lens Style: Flat; Lens Transparency: Clear; Luminous Intensity: 400mcd; Forward Voltage: 3.3V; Test Current: 20mA; Viewing Angle: 130°; Dominant Wavelength: 525nm; Lens Size: 0.8mm; Added by: viskov2055@gmail.com; Solder_Amount: 2; Pkg: 0603; RoHS: Yes; Category: LEDs; Stock 1: 44996; Pricing 1: 1=0,6, 10=0,368, 100=0,2114, 1000=0,16544, 2000=0,15165 (USD); MountType: SMD; Case/Package: 0603; Color: Green; Case Code (Imperial): 0603; Case Code (Metric): 1608; Packaging: Tape and Reel; Length: 1.6mm; Width: 0.8mm; Height: 0.28mm; RoHS Compliant: Yes; ComponentLink1URL: https://datasheet.octopart.com/APG1608ZGCK-Kingbright-datasheet-153682089.pdf?src-supplier=Future+Electronics; ComponentLink1Description: https://datasheet.octopart.com/APG1608ZGCK-Kingbright-datasheet-153682089.pdf?src-supplier=Future+Electronics; ComponentLink2URL: http://www.kingbrightusa.com/images/catalog/SPEC/APG1608ZGCK.pdf?src-supplier=Digikey; ComponentLink2Description: http://www.kingbrightusa.com/images/catalog/SPEC/APG1608ZGCK.pdf?src-supplier=Digikey; ComponentLink3URL: https://datasheet.octopart.com/APG1608ZGCK-Kingbright-datasheet-137408059.pdf?src-supplier=Sager+Electronics; ComponentLink3Description: https://datasheet.octopart.com/APG1608ZGCK-Kingbright-datasheet-137408059.pdf?src-supplier=Sager+Electronics; Supplier Part Number 1: 754-2113-1-ND; Created at: 13/02/2024; Mount: MOUNT; Part Number: APG1608ZGCK; Supplier 1: Digikey
VT73-VT90 = BSS138: N-Channel Logic Level Enhancement Mode Field Effect Transistor; Solder_Amount: 3; Added_by: ma_lubushkin@teslatec.ru; Pkg: SOT-23; Part Number: BSS138; Mount: MOUNT; MountType: SMD; Created_at: 03/12/2019

## Sheet IDC_Tester_v1_LED_6.SchDoc
size A4; SheetNumber: 8; SheetTotal: 9
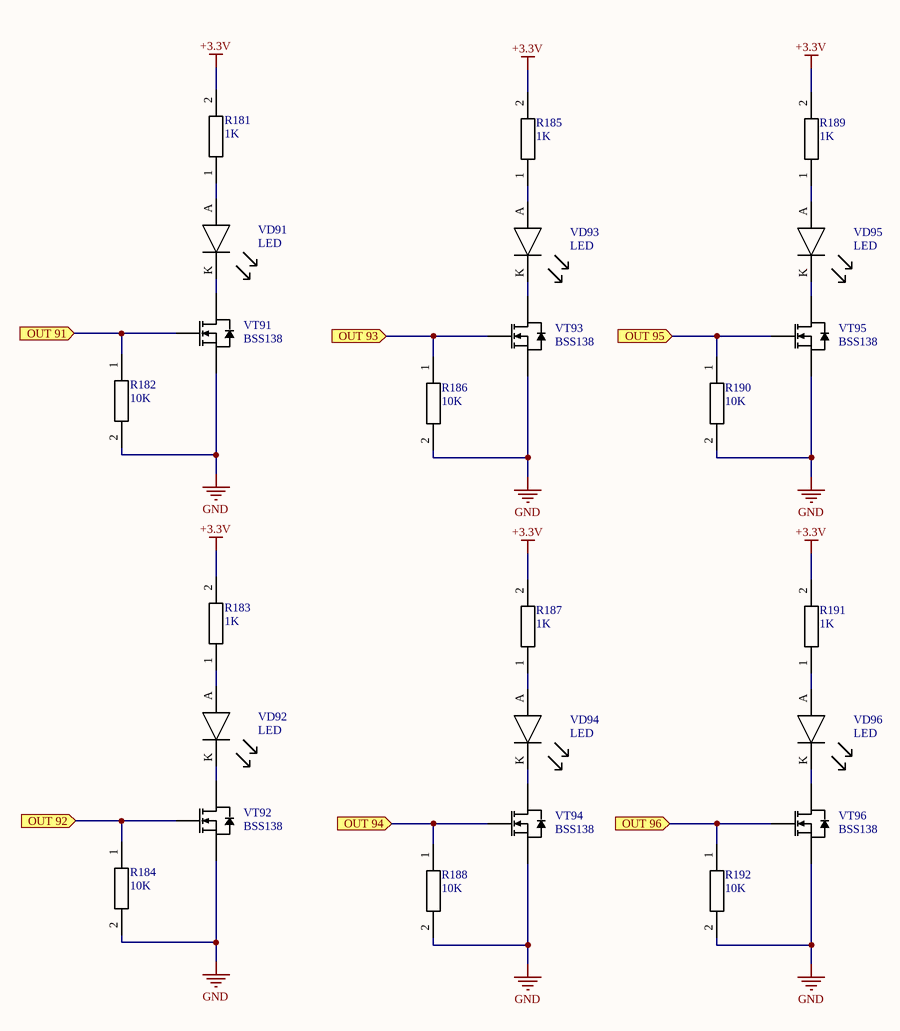
[diagram p8: IDC_Tester_v1_LED_6.SchDoc]

### Parts
R181  1K  [Resistor 0603]
R182  10K  [Resistor 0603]
R183  1K  [Resistor 0603]
R184  10K  [Resistor 0603]
R185  1K  [Resistor 0603]
R186  10K  [Resistor 0603]
R187  1K  [Resistor 0603]
R188  10K  [Resistor 0603]
R189  1K  [Resistor 0603]
R190  10K  [Resistor 0603]
R191  1K  [Resistor 0603]
R192  10K  [Resistor 0603]
VD91  LED  [Led 0603 - duplicate]
VD92  LED  [Led 0603 - duplicate]
VD93  LED  [Led 0603 - duplicate]
VD94  LED  [Led 0603 - duplicate]
VD95  LED  [Led 0603 - duplicate]
VD96  LED  [Led 0603 - duplicate]
VT91  BSS138  [SOT-23-3]
VT92  BSS138  [SOT-23-3]
VT93  BSS138  [SOT-23-3]
VT94  BSS138  [SOT-23-3]
VT95  BSS138  [SOT-23-3]
VT96  BSS138  [SOT-23-3]

### Ports
OUT 91 (in), OUT 92 (in), OUT 93 (in), OUT 94 (in), OUT 95 (in), OUT 96 (in)

### Nets
+3.3V: R181.2 R183.2 R185.2 R187.2 R189.2 R191.2
GND: R182.2 R184.2 R186.2 R188.2 R190.2 R192.2 VT91.2(S) VT92.2(S) VT93.2(S) VT94.2(S) VT95.2(S) VT96.2(S)
NetDD25_3: R186.1 VT93.1(G) ; port OUT 93
NetDD25_4: R188.1 VT94.1(G) ; port OUT 94
NetDD25_5: R190.1 VT95.1(G) ; port OUT 95
NetDD25_6: R192.1 VT96.1(G) ; port OUT 96
NetDD25_13: R182.1 VT91.1(G) ; port OUT 91
NetDD25_14: R184.1 VT92.1(G) ; port OUT 92
NetR181_1: R181.1 VD91.A
NetR183_1: R183.1 VD92.A
NetR185_1: R185.1 VD93.A
NetR187_1: R187.1 VD94.A
NetR189_1: R189.1 VD95.A
NetR191_1: R191.1 VD96.A
NetVD91_K: VD91.K VT91.3(D)
NetVD92_K: VD92.K VT92.3(D)
NetVD93_K: VD93.K VT93.3(D)
NetVD94_K: VD94.K VT94.3(D)
NetVD95_K: VD95.K VT95.3(D)
NetVD96_K: VD96.K VT96.3(D)

### Library data of the parts
R181 R183 R185 R187 R189 R191 = Resistor 1K: as R145 on sheet IDC_Tester_v1_LED_5; Created at: 13/02/2024; Mount: MOUNT
R182 R184 R186 R188 R190 R192 = Resistor 10K: as R146 on sheet IDC_Tester_v1_LED_5; Created at: 15/02/2024; Mount: MOUNT
VD91-VD96 = LED: as VD73-VD90 on sheet IDC_Tester_v1_LED_5; RoHS: Yes; Category: LEDs; Stock 1: 44996; Pricing 1: 1=0,6, 10=0,368, 100=0,2114, 1000=0,16544, 2000=0,15165 (USD); MountType: SMD; Case/Package: 0603; Color: Green; Case Code (Imperial): 0603; Case Code (Metric): 1608; Packaging: Tape and Reel; Length: 1.6mm; Width: 0.8mm; Height: 0.28mm; RoHS Compliant: Yes; ComponentLink1URL: https://datasheet.octopart.com/APG1608ZGCK-Kingbright-datasheet-153682089.pdf?src-supplier=Future+Electronics; ComponentLink1Description: https://datasheet.octopart.com/APG1608ZGCK-Kingbright-datasheet-153682089.pdf?src-supplier=Future+Electronics; ComponentLink2URL: http://www.kingbrightusa.com/images/catalog/SPEC/APG1608ZGCK.pdf?src-supplier=Digikey; ComponentLink2Description: http://www.kingbrightusa.com/images/catalog/SPEC/APG1608ZGCK.pdf?src-supplier=Digikey; ComponentLink3URL: https://datasheet.octopart.com/APG1608ZGCK-Kingbright-datasheet-137408059.pdf?src-supplier=Sager+Electronics; ComponentLink3Description: https://datasheet.octopart.com/APG1608ZGCK-Kingbright-datasheet-137408059.pdf?src-supplier=Sager+Electronics; Supplier Part Number 1: 754-2113-1-ND; Created at: 13/02/2024; Mount: MOUNT; Part Number: APG1608ZGCK; Supplier 1: Digikey
VT91-VT96 = BSS138: as VT73-VT90 on sheet IDC_Tester_v1_LED_5; Part Number: BSS138; Mount: MOUNT; MountType: SMD; Created_at: 03/12/2019

## Sheet IDC_Tester_v1_sift_register_input.SchDoc
size 420 x 297 mm; SheetNumber: 10; SheetTotal: 10
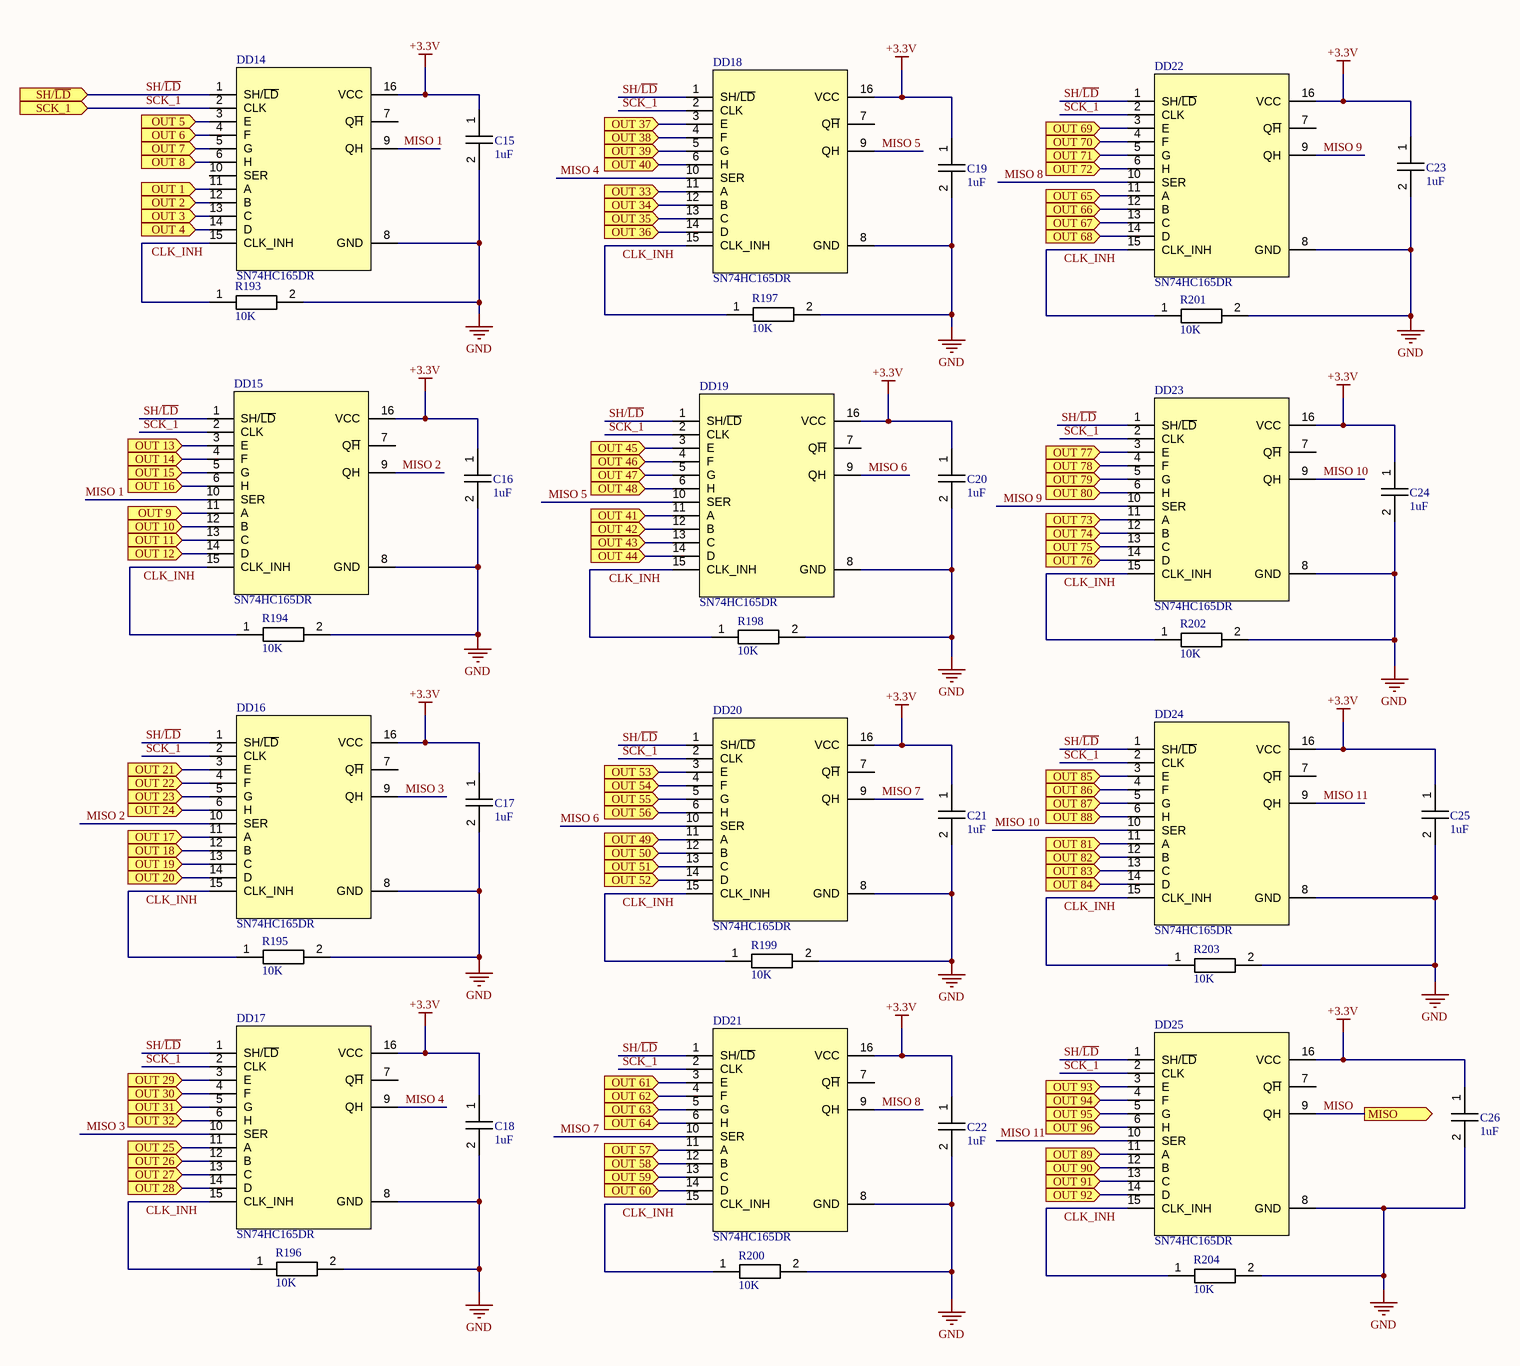
[diagram p9: IDC_Tester_v1_sift_register_input.SchDoc]

### Parts
C15  1uF  [Capacitor 0603]
C16  1uF  [Capacitor 0603]
C17  1uF  [Capacitor 0603]
C18  1uF  [Capacitor 0603]
C19  1uF  [Capacitor 0603]
C20  1uF  [Capacitor 0603]
C21  1uF  [Capacitor 0603]
C22  1uF  [Capacitor 0603]
C23  1uF  [Capacitor 0603]
C24  1uF  [Capacitor 0603]
C25  1uF  [Capacitor 0603]
C26  1uF  [Capacitor 0603]
DD14  SN74HC165DR  [Shift register 74HC165 or 74HC595]
DD15  SN74HC165DR  [Shift register 74HC165 or 74HC595]
DD16  SN74HC165DR  [Shift register 74HC165 or 74HC595]
DD17  SN74HC165DR  [Shift register 74HC165 or 74HC595]
DD18  SN74HC165DR  [Shift register 74HC165 or 74HC595]
DD19  SN74HC165DR  [Shift register 74HC165 or 74HC595]
DD20  SN74HC165DR  [Shift register 74HC165 or 74HC595]
DD21  SN74HC165DR  [Shift register 74HC165 or 74HC595]
DD22  SN74HC165DR  [Shift register 74HC165 or 74HC595]
DD23  SN74HC165DR  [Shift register 74HC165 or 74HC595]
DD24  SN74HC165DR  [Shift register 74HC165 or 74HC595]
DD25  SN74HC165DR  [Shift register 74HC165 or 74HC595]
R193  10K  [Resistor 0603]
R194  10K  [Resistor 0603]
R195  10K  [Resistor 0603]
R196  10K  [Resistor 0603]
R197  10K  [Resistor 0603]
R198  10K  [Resistor 0603]
R199  10K  [Resistor 0603]
R200  10K  [Resistor 0603]
R201  10K  [Resistor 0603]
R202  10K  [Resistor 0603]
R203  10K  [Resistor 0603]
R204  10K  [Resistor 0603]

### Ports
MISO (out), OUT 1 (in), OUT 2 (in), OUT 3 (in), OUT 4 (in), OUT 5 (in), OUT 6 (in), OUT 7 (in), OUT 8 (in), OUT 9 (in), OUT 10 (in), OUT 11 (in), OUT 12 (in), OUT 13 (in), OUT 14 (in), OUT 15 (in), OUT 16 (in), OUT 17 (in), OUT 18 (in), OUT 19 (in), OUT 20 (in), OUT 21 (in), OUT 22 (in), OUT 23 (in), OUT 24 (in), OUT 25 (in), OUT 26 (in), OUT 27 (in), OUT 28 (in), OUT 29 (in), OUT 30 (in), OUT 31 (in), OUT 32 (in), OUT 33 (in), OUT 34 (in), OUT 35 (in), OUT 36 (in), OUT 37 (in), OUT 38 (in), OUT 39 (in), OUT 40 (in), OUT 41 (in), OUT 42 (in), OUT 43 (in), OUT 44 (in), OUT 45 (in), OUT 46 (in), OUT 47 (in), OUT 48 (in), OUT 49 (in), OUT 50 (in), OUT 51 (in), OUT 52 (in), OUT 53 (in), OUT 54 (in), OUT 55 (in), OUT 56 (in), OUT 57 (in), OUT 58 (in), OUT 59 (in), OUT 60 (in), OUT 61 (in), OUT 62 (in), OUT 63 (in), OUT 64 (in), OUT 65 (in), OUT 66 (in), OUT 67 (in), OUT 68 (in), OUT 69 (in), OUT 70 (in), OUT 71 (in), OUT 72 (in), OUT 73 (in), OUT 74 (in), OUT 75 (in), OUT 76 (in), OUT 77 (in), OUT 78 (in), OUT 79 (in), OUT 80 (in), OUT 81 (in), OUT 82 (in), OUT 83 (in), OUT 84 (in), OUT 85 (in), OUT 86 (in), OUT 87 (in), OUT 88 (in), OUT 89 (in), OUT 90 (in), OUT 91 (in), OUT 92 (in), OUT 93 (in), OUT 94 (in), OUT 95 (in), OUT 96 (in), SCK_1 (in), SH/~{LD} (in)

### Nets
+3.3V: C15.1 C16.1 C17.1 C18.1 C19.1 C20.1 C21.1 C22.1 C23.1 C24.1 C25.1 C26.1 DD14.16(VCC) DD15.16(VCC) DD16.16(VCC) DD17.16(VCC) DD18.16(VCC) DD19.16(VCC) DD20.16(VCC) DD21.16(VCC) DD22.16(VCC) DD23.16(VCC) DD24.16(VCC) DD25.16(VCC)
GND: C15.2 C16.2 C17.2 C18.2 C19.2 C20.2 C21.2 C22.2 C23.2 C24.2 C25.2 C26.2 DD14.8(GND) DD15.8(GND) DD16.8(GND) DD17.8(GND) DD18.8(GND) DD19.8(GND) DD20.8(GND) DD21.8(GND) DD22.8(GND) DD23.8(GND) DD24.8(GND) DD25.8(GND) R193.2 R194.2 R195.2 R196.2 R197.2 R198.2 R199.2 R200.2 R201.2 R202.2 R203.2 R204.2
CLK_INH: DD14.15(CLK_INH) DD15.15(CLK_INH) DD16.15(CLK_INH) DD17.15(CLK_INH) DD18.15(CLK_INH) DD19.15(CLK_INH) DD20.15(CLK_INH) DD21.15(CLK_INH) DD22.15(CLK_INH) DD23.15(CLK_INH) DD24.15(CLK_INH) DD25.15(CLK_INH) R193.1 R194.1 R195.1 R196.1 R197.1 R198.1 R199.1 R200.1 R201.1 R202.1 R203.1 R204.1
MISO: DD25.9(QH) ; port MISO
MISO 1: DD14.9(QH) DD15.10(SER)
MISO 2: DD15.9(QH) DD16.10(SER)
MISO 3: DD16.9(QH) DD17.10(SER)
MISO 4: DD17.9(QH) DD18.10(SER)
MISO 5: DD18.9(QH) DD19.10(SER)
MISO 6: DD19.9(QH) DD20.10(SER)
MISO 7: DD20.9(QH) DD21.10(SER)
MISO 8: DD21.9(QH) DD22.10(SER)
MISO 9: DD22.9(QH) DD23.10(SER)
MISO 10: DD23.9(QH) DD24.10(SER)
MISO 11: DD24.9(QH) DD25.10(SER)
SCK_1: DD14.2(CLK) DD15.2(CLK) DD16.2(CLK) DD17.2(CLK) DD18.2(CLK) DD19.2(CLK) DD20.2(CLK) DD21.2(CLK) DD22.2(CLK) DD23.2(CLK) DD24.2(CLK) DD25.2(CLK) ; port SCK_1
SH/~{LD}: DD14.1(SH/~{LD}) DD15.1(SH/~{LD}) DD16.1(SH/~{LD}) DD17.1(SH/~{LD}) DD18.1(SH/~{LD}) DD19.1(SH/~{LD}) DD20.1(SH/~{LD}) DD21.1(SH/~{LD}) DD22.1(SH/~{LD}) DD23.1(SH/~{LD}) DD24.1(SH/~{LD}) DD25.1(SH/~{LD}) ; port SH/~{LD}
NetDD14_3: DD14.3(E) ; port OUT 5
NetDD14_4: DD14.4(F) ; port OUT 6
NetDD14_5: DD14.5(G) ; port OUT 7
NetDD14_6: DD14.6(H) ; port OUT 8
NetDD14_11: DD14.11(A) ; port OUT 1
NetDD14_12: DD14.12(B) ; port OUT 2
NetDD14_13: DD14.13(C) ; port OUT 3
NetDD14_14: DD14.14(D) ; port OUT 4
NetDD15_3: DD15.3(E) ; port OUT 13
NetDD15_4: DD15.4(F) ; port OUT 14
NetDD15_5: DD15.5(G) ; port OUT 15
NetDD15_6: DD15.6(H) ; port OUT 16
NetDD15_11: DD15.11(A) ; port OUT 9
NetDD15_12: DD15.12(B) ; port OUT 10
NetDD15_13: DD15.13(C) ; port OUT 11
NetDD15_14: DD15.14(D) ; port OUT 12
NetDD16_3: DD16.3(E) ; port OUT 21
NetDD16_4: DD16.4(F) ; port OUT 22
NetDD16_5: DD16.5(G) ; port OUT 23
NetDD16_6: DD16.6(H) ; port OUT 24
NetDD16_11: DD16.11(A) ; port OUT 17
NetDD16_12: DD16.12(B) ; port OUT 18
NetDD16_13: DD16.13(C) ; port OUT 19
NetDD16_14: DD16.14(D) ; port OUT 20
NetDD17_3: DD17.3(E) ; port OUT 29
NetDD17_4: DD17.4(F) ; port OUT 30
NetDD17_5: DD17.5(G) ; port OUT 31
NetDD17_6: DD17.6(H) ; port OUT 32
NetDD17_11: DD17.11(A) ; port OUT 25
NetDD17_12: DD17.12(B) ; port OUT 26
NetDD17_13: DD17.13(C) ; port OUT 27
NetDD17_14: DD17.14(D) ; port OUT 28
NetDD18_3: DD18.3(E) ; port OUT 37
NetDD18_4: DD18.4(F) ; port OUT 38
NetDD18_5: DD18.5(G) ; port OUT 39
NetDD18_6: DD18.6(H) ; port OUT 40
NetDD18_11: DD18.11(A) ; port OUT 33
NetDD18_12: DD18.12(B) ; port OUT 34
NetDD18_13: DD18.13(C) ; port OUT 35
NetDD18_14: DD18.14(D) ; port OUT 36
NetDD19_3: DD19.3(E) ; port OUT 45
NetDD19_4: DD19.4(F) ; port OUT 46
NetDD19_5: DD19.5(G) ; port OUT 47
NetDD19_6: DD19.6(H) ; port OUT 48
NetDD19_11: DD19.11(A) ; port OUT 41
NetDD19_12: DD19.12(B) ; port OUT 42
NetDD19_13: DD19.13(C) ; port OUT 43
NetDD19_14: DD19.14(D) ; port OUT 44
NetDD20_3: DD20.3(E) ; port OUT 53
NetDD20_4: DD20.4(F) ; port OUT 54
NetDD20_5: DD20.5(G) ; port OUT 55
NetDD20_6: DD20.6(H) ; port OUT 56
NetDD20_11: DD20.11(A) ; port OUT 49
NetDD20_12: DD20.12(B) ; port OUT 50
NetDD20_13: DD20.13(C) ; port OUT 51
NetDD20_14: DD20.14(D) ; port OUT 52
NetDD21_3: DD21.3(E) ; port OUT 61
NetDD21_4: DD21.4(F) ; port OUT 62
NetDD21_5: DD21.5(G) ; port OUT 63
NetDD21_6: DD21.6(H) ; port OUT 64
NetDD21_11: DD21.11(A) ; port OUT 57
NetDD21_12: DD21.12(B) ; port OUT 58
NetDD21_13: DD21.13(C) ; port OUT 59
NetDD21_14: DD21.14(D) ; port OUT 60
NetDD22_3: DD22.3(E) ; port OUT 69
NetDD22_4: DD22.4(F) ; port OUT 70
NetDD22_5: DD22.5(G) ; port OUT 71
NetDD22_6: DD22.6(H) ; port OUT 72
NetDD22_11: DD22.11(A) ; port OUT 65
NetDD22_12: DD22.12(B) ; port OUT 66
NetDD22_13: DD22.13(C) ; port OUT 67
NetDD22_14: DD22.14(D) ; port OUT 68
NetDD23_3: DD23.3(E) ; port OUT 77
NetDD23_4: DD23.4(F) ; port OUT 78
NetDD23_5: DD23.5(G) ; port OUT 79
NetDD23_6: DD23.6(H) ; port OUT 80
NetDD23_11: DD23.11(A) ; port OUT 73
NetDD23_12: DD23.12(B) ; port OUT 74
NetDD23_13: DD23.13(C) ; port OUT 75
NetDD23_14: DD23.14(D) ; port OUT 76
NetDD24_3: DD24.3(E) ; port OUT 85
NetDD24_4: DD24.4(F) ; port OUT 86
NetDD24_5: DD24.5(G) ; port OUT 87
NetDD24_6: DD24.6(H) ; port OUT 88
NetDD24_11: DD24.11(A) ; port OUT 81
NetDD24_12: DD24.12(B) ; port OUT 82
NetDD24_13: DD24.13(C) ; port OUT 83
NetDD24_14: DD24.14(D) ; port OUT 84
NetDD25_3: DD25.3(E) ; port OUT 93
NetDD25_4: DD25.4(F) ; port OUT 94
NetDD25_5: DD25.5(G) ; port OUT 95
NetDD25_6: DD25.6(H) ; port OUT 96
NetDD25_11: DD25.11(A) ; port OUT 89
NetDD25_12: DD25.12(B) ; port OUT 90
NetDD25_13: DD25.13(C) ; port OUT 91
NetDD25_14: DD25.14(D) ; port OUT 92

Not connected (* = marked no-connect by the designer): DD14 7(Q~{H}) 10(SER); DD15 7(Q~{H}); DD16 7(Q~{H}); DD17 7(Q~{H}); DD18 7(Q~{H}); DD19 7(Q~{H}); DD20 7(Q~{H}); DD21 7(Q~{H}); DD22 7(Q~{H}); DD23 7(Q~{H}); DD24 7(Q~{H}); DD25 7(Q~{H})

### Notes on the sheet
- THIS DOCUMENT AND THE DATA DISCLOSED HEREIN OR
- HEREWITH IS THE PROPERTY OF ALTIUM LIMITED AND MAY
- DWG NO:
- REVISION
- REV:
- DESCRIPTION
- DATE
- APPROVED
- BE FREELY DISTRIBUTED IN WHOLE. NO RIGHTS ARE
- RESERVED OR EXPRESS OR IMPLIED WARANTEE GIVEN.
- ENG:
- APPROVALS
- PROJECT
- DSN:
- CHK:
- REFERENCE DOCUMENTS
- PROJECT REVISION:
- TITLE
- DOCUMENT REVISION:
- DESIGN ITEM:
- BOM:
- FAB DWG:
- PCB DWG:
- ASSY DWG:
- SCALE:
- A3
- SIZE
- CAGE CODE
- FILE NAME
- DWG NO.
- SHEET
- OF
- REV

### Library data of the parts
C15-C26 = Capacitor: Part Number: SMD CAP CER 1UF 25V X5R 0603 (CC0603KRX5R8BB105); Added by: viskov2055@gmail.com; Mount_Type: SMD; Solder_Amount: 2; Pkg: 0603; Created at: 16/02/2024; Mount: MOUNT
DD14-DD25 = SN74HC165DR: IC 8-BIT SHIFT REGISTER 16-SOIC; Manufacturer: Texas Instruments; Added by: viskov2055@gmail.com; Mount_Type: SMD; Solder_Amount: 16; Supplier 1: Digikey; Manufacturer Part Number: SN74HC165DR; RoHS: Yes; Category: Shift Registers; Stock 1: 2933; Pricing 1: 1=0,47, 10=0,357, 25=0,322, 100=0,2226, 250=0,18744, 500=0,1523, 1000=0,11716 (USD); ComponentLink1URL: https://datasheet.ciiva.com/15093/getdatasheetpartid-251161-15093655.pdf?src-supplier=Verical; ComponentLink1Description: https://datasheet.ciiva.com/15093/getdatasheetpartid-251161-15093655.pdf?src-supplier=Verical; ComponentLink2URL: https://datasheet.ciiva.com/34301/915180-34301754.pdf?src-supplier=Jameco; ComponentLink2Description: https://datasheet.ciiva.com/34301/915180-34301754.pdf?src-supplier=Jameco; ComponentLink3URL: https://datasheet.ciiva.com/41456/001016679-da-01-en-ic-8bit-shft-reg-sn74hc165dr-soic-16-tid-41456900.pdf?src-supplier=Conrad; ComponentLink3Description: https://datasheet.ciiva.com/41456/001016679-da-01-en-ic-8bit-shft-reg-sn74hc165dr-soic-16-tid-41456900.pdf?src-supplier=Conrad; ComponentLink4URL: https://datasheet.ciiva.com/46397/1831348-46397223.pdf?src-supplier=Element14; ComponentLink4Description: https://datasheet.ciiva.com/46397/1831348-46397223.pdf?src-supplier=Element14; ComponentLink5URL: https://datasheet.ciiva.com/14295/sn54hc165-14295050.pdf?src-supplier=Avnet; ComponentLink5Description: https://datasheet.ciiva.com/14295/sn54hc165-14295050.pdf?src-supplier=Avnet; ComponentLink6URL: https://datasheet.ciiva.com/14295/sn54hc165-14295052.pdf?src-supplier=Avnet; ComponentLink6Description: https://datasheet.ciiva.com/14295/sn54hc165-14295052.pdf?src-supplier=Avnet; ComponentLink7URL: https://datasheet.ciiva.com/1886/sn74hc165-1886212.pdf?src-supplier=Digikey; ComponentLink7Description: https://datasheet.ciiva.com/1886/sn74hc165-1886212.pdf?src-supplier=Digikey; ComponentLink8URL: https://datasheet.ciiva.com/1886/sn74hc165-1886213.pdf?src-supplier=Digikey; ComponentLink8Description: https://datasheet.ciiva.com/1886/sn74hc165-1886213.pdf?src-supplier=Digikey; ComponentLink9URL: https://datasheet.ciiva.com/1886/sn74hc165-1886214.pdf?src-supplier=Digikey; ComponentLink9Description: https://datasheet.ciiva.com/1886/sn74hc165-1886214.pdf?src-supplier=Digikey; Supplier Part Number 1: 296-8250-1-ND; Created at: 13/02/2024; Mount: MOUNT; Pkg: 16-SOIC; Part number: SN74HC165DR
R193-R204 = Resistor 10K: as R146 on sheet IDC_Tester_v1_LED_5; Created at: 15/02/2024; Mount: MOUNT